# Altium project DS1682.PrjPcb
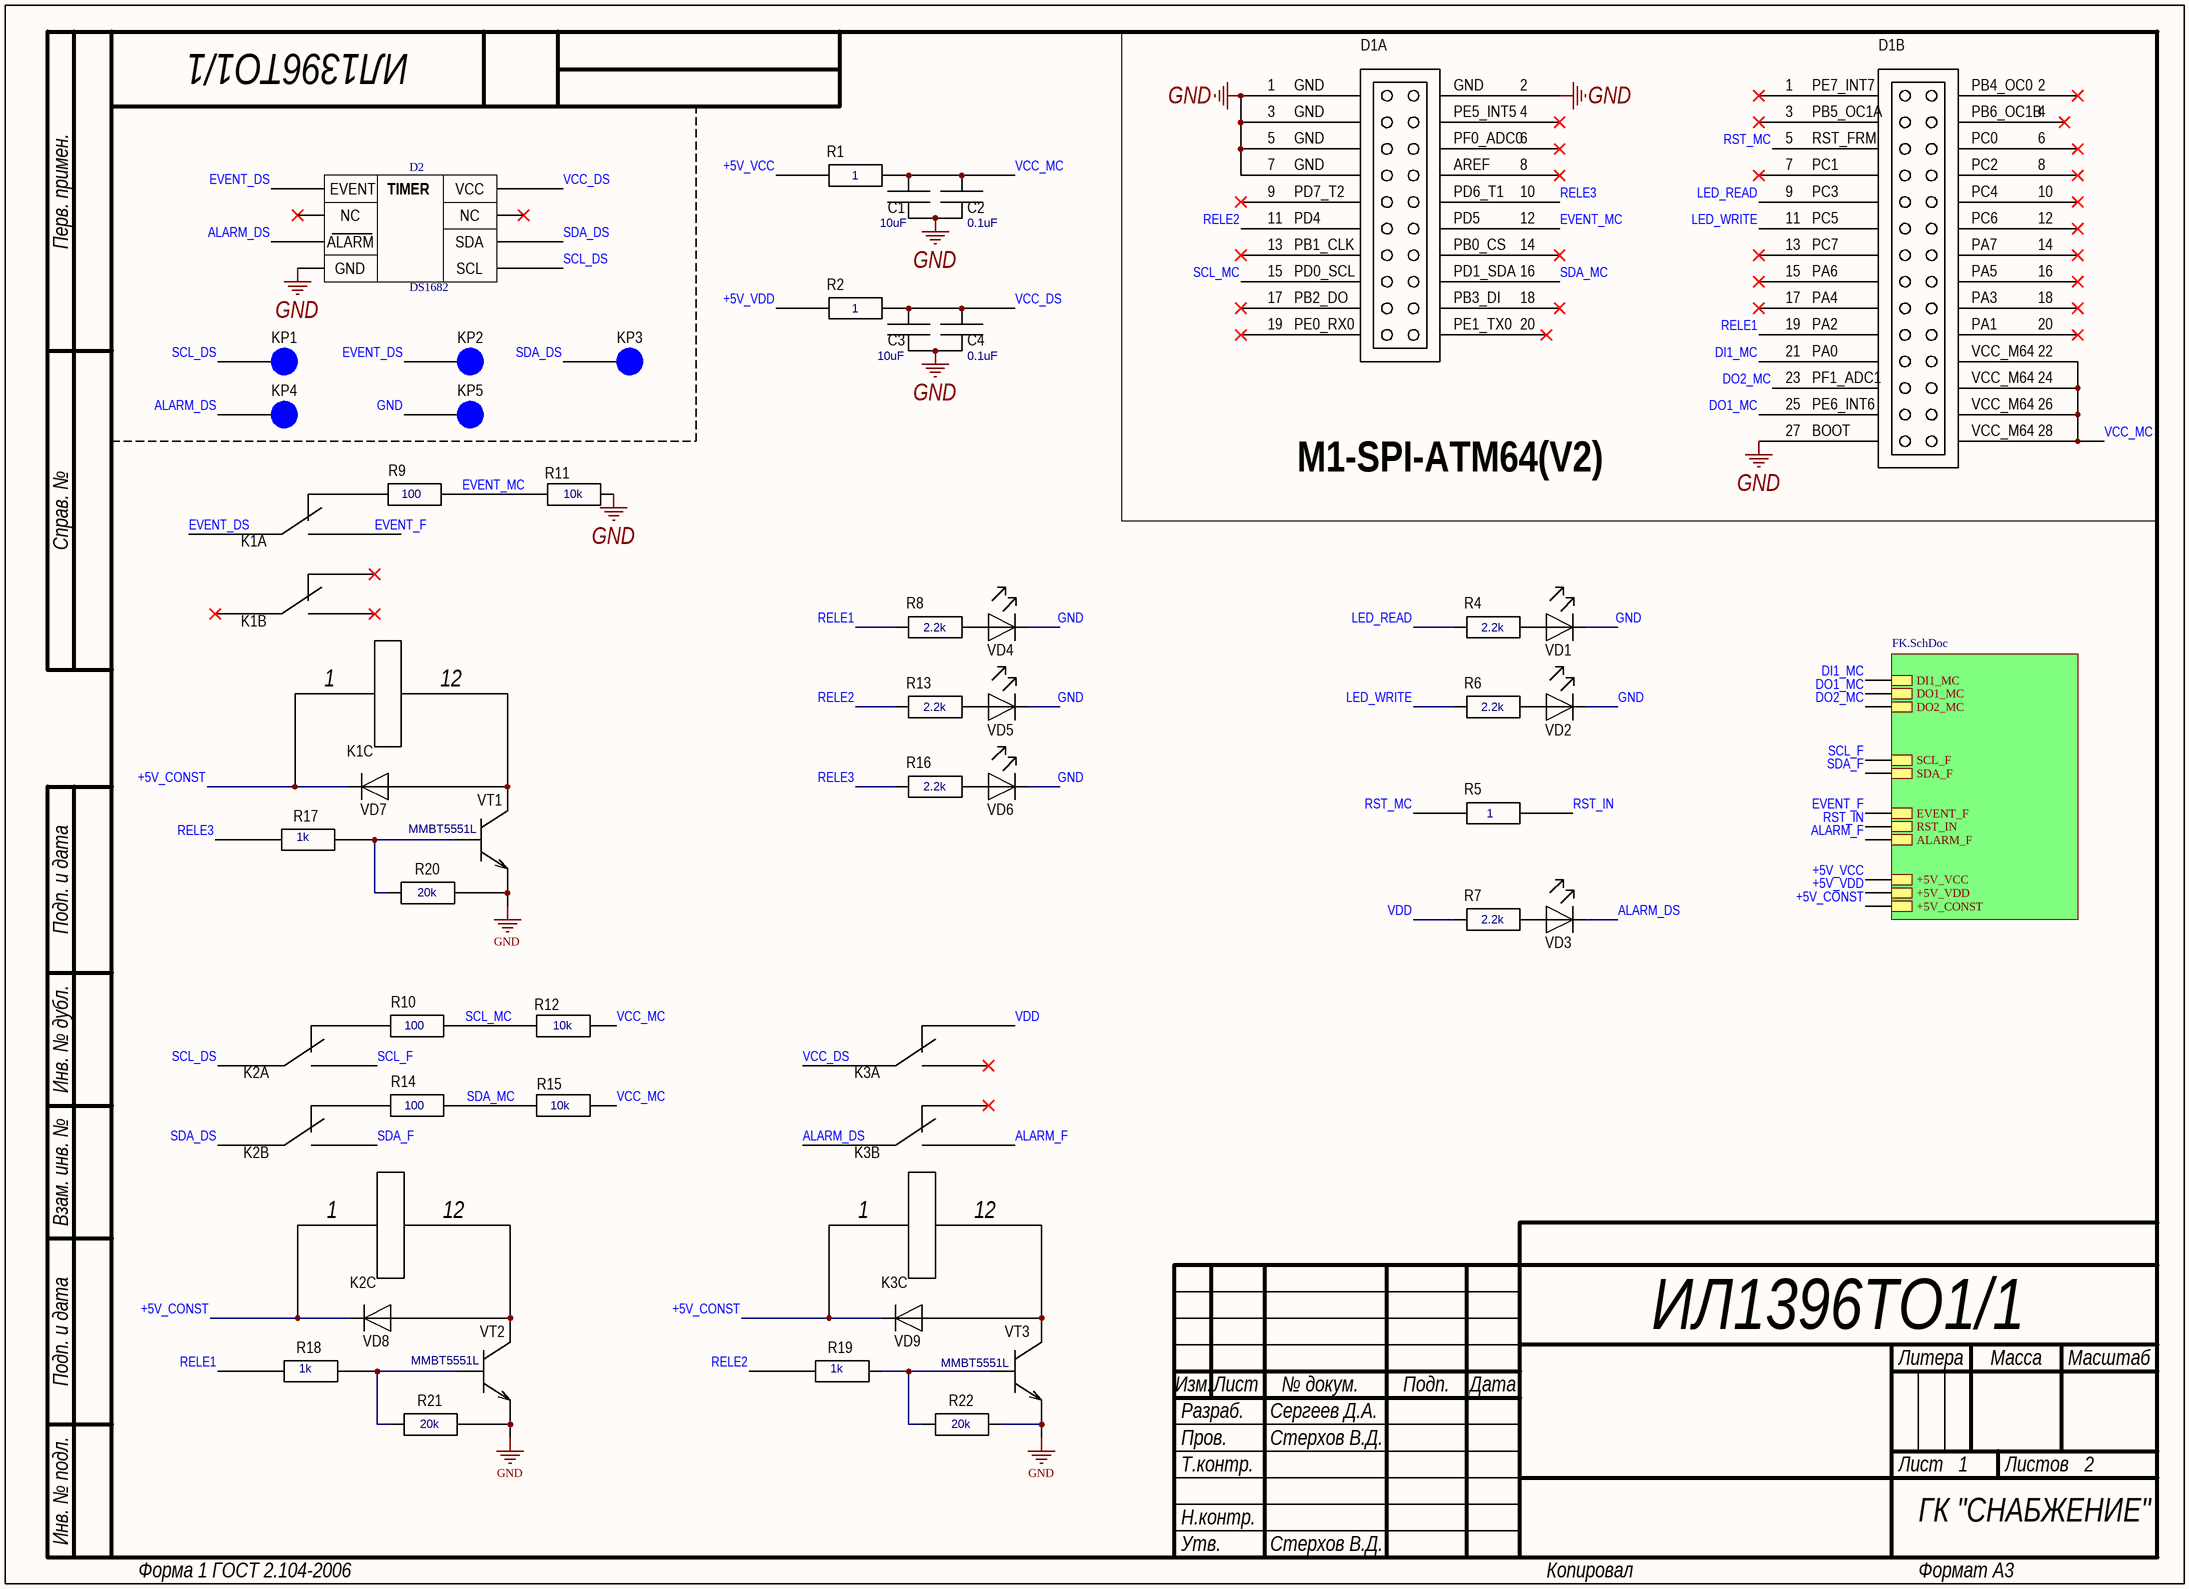
[diagram p0: Sheet1.SchDoc]
2 sheets, 48 parts. Net scope: hierarchical (ports join the sheet entries above them; power ports are global).
Board file: PCB1.PcbDoc
Sheets:
  Sheet1.SchDoc
    UCP_s22 = FK.SchDoc

## Sheet Sheet1.SchDoc: ИЛ1396ТО1/1
size 410 x 297 mm; ApprovedBy: Стерхов В.Д.; CheckedBy: Стерхов В.Д.; Author: Сергеев Д.А.; CompanyName: ГК "СНАБЖЕНИЕ"; DrawnBy: Сергеев Д.А.; Engineer: Сергеев Д.А.; Organization: ГК "СНАБЖЕНИЕ"; DocumentNumber: ИЛ1396ТО1/1; Revision: 1; SheetNumber: 1; SheetTotal: 2

### Parts
C1  10uF  [0805]
C2  0.1uF  [0805]
C3  10uF  [0805]
C4  0.1uF  [0805]
D1  M1-SPI-ATM64(V2)  [M1-SPI-ATM64(V2)]  (value not drawn)  (parts A,B of 2)
D2  DS1682  [SO-8 to PLS-8]
K1  V23079A1001B301 TE  [V23079A1001B301]  (value not drawn)  (parts A,B,C of 3)
K2  V23079A1001B301 TE  [V23079A1001B301]  (value not drawn)  (parts A,B,C of 3)
K3  V23079A1001B301 TE  [V23079A1001B301]  (value not drawn)  (parts A,B,C of 3)
KP1  Contact  [Contact]  (value not drawn)
KP2  Contact  [Contact]  (value not drawn)
KP3  Contact  [Contact]  (value not drawn)
KP4  Contact  [Contact]  (value not drawn)
KP5  Contact  [Contact]  (value not drawn)
R1  1  [0805]
R2  1  [0805]
R4  2.2k  [0805]
R5  1  [0805]
R6  2.2k  [0805]
R7  2.2k  [0805]
R8  2.2k  [0805]
R9  100  [0805]
R10  100  [0805]
R11  10k  [0805]
R12  10k  [0805]
R13  2.2k  [0805]
R14  100  [0805]
R15  10k  [0805]
R16  2.2k  [0805]
R17  1k  [0805]
R18  1k  [0805]
R19  1k  [0805]
R20  20k  [0805]
R21  20k  [0805]
R22  20k  [0805]
VD1  LED(0805)  [0805(LED)]  (value not drawn)
VD2  LED(0805)  [0805(LED)]  (value not drawn)
VD3  LED(0805)  [0805(LED)]  (value not drawn)
VD4  LED(0805)  [0805(LED)]  (value not drawn)
VD5  LED(0805)  [0805(LED)]  (value not drawn)
VD6  LED(0805)  [0805(LED)]  (value not drawn)
VD7  LL4148 NXP  [SOD80C]  (value not drawn)
VD8  LL4148 NXP  [SOD80C]  (value not drawn)
VD9  LL4148 NXP  [SOD80C]  (value not drawn)
VT1  MMBT5551L  [SOT-23]
VT2  MMBT5551L  [SOT-23]
VT3  MMBT5551L  [SOT-23]

### Sub-sheets
UCP_s22 = FK.SchDoc: DI1_MC, +5V_CONST, EVENT_F, RST_IN, +5V_VCC, SDA_F, DO1_MC, +5V_VDD, DO2_MC, ALARM_F, SCL_F

### Nets
GND: C1.2 C2.2 C3.2 C4.2 D1.1X2 D1.2X2 D1.3X2 D1.5X2 D1.7X2 D1.27X3 D2.4 KP5.1 R11.2 R20.2 R21.2 R22.2 VD1.2(K) VD2.2(K) VD4.2(K) VD5.2(K) VD6.2(K) VT1.2(E) VT2.2(E) VT3.2(E)
+5V_CONST: K1.1 K2.1 K3.1 VD7.2(K) VD8.2(K) VD9.2(K) ; sheet UCP_s22/+5V_CONST
+5V_VCC: R1.1 ; sheet UCP_s22/+5V_VCC
+5V_VDD: R2.1 ; sheet UCP_s22/+5V_VDD
ALARM_DS: D2.3 K3.9 KP4.1 VD3.2(K)
ALARM_F: K3.8 ; sheet UCP_s22/ALARM_F
DI1_MC: D1.21X3 ; sheet UCP_s22/DI1_MC
DO1_MC: D1.25X3 ; sheet UCP_s22/DO1_MC
DO2_MC: D1.23X3 ; sheet UCP_s22/DO2_MC
EVENT_DS: D2.1 K1.4 KP2.1
EVENT_F: K1.5 ; sheet UCP_s22/EVENT_F
EVENT_MC: D1.12X2 R9.2 R11.1
LED_READ: D1.9X3 R4.1
LED_WRITE: D1.11X3 R6.1
RELE1: D1.19X3 R8.1 R18.1
RELE2: D1.11X2 R13.1 R19.1
RELE3: D1.10X2 R16.1 R17.1
RST_IN: R5.2 ; sheet UCP_s22/RST_IN
RST_MC: D1.5X3 R5.1
SCL_DS: D2.5 K2.4 KP1.1
SCL_F: K2.5 ; sheet UCP_s22/SCL_F
SCL_MC: D1.15X2 R10.2 R12.1
SDA_DS: D2.6 K2.9 KP3.1
SDA_F: K2.8 ; sheet UCP_s22/SDA_F
SDA_MC: D1.16X2 R14.2 R15.1
VCC_DS: C3.1 C4.1 D2.8 K3.4 R2.2
VCC_MC: C1.1 C2.1 D1.22X3 D1.24X3 D1.26X3 D1.28X3 R1.2 R12.2 R15.2
VDD: K3.3 R7.1
NetK1_3: K1.3 R9.1
NetK1_12: K1.12 VD7.1(A) VT1.3(K)
NetK2_3: K2.3 R10.1
NetK2_10: K2.10 R14.1
NetK2_12: K2.12 VD8.1(A) VT2.3(K)
NetK3_12: K3.12 VD9.1(A) VT3.3(K)
NetR4_2: R4.2 VD1.1(A)
NetR6_2: R6.2 VD2.1(A)
NetR7_2: R7.2 VD3.1(A)
NetR8_2: R8.2 VD4.1(A)
NetR13_2: R13.2 VD5.1(A)
NetR16_2: R16.2 VD6.1(A)
NetR17_2: R17.2 R20.1 VT1.1(B)
NetR18_2: R18.2 R21.1 VT2.1(B)
NetR19_2: R19.2 R22.1 VT3.1(B)

Not connected (* = marked no-connect by the designer): D1 1X3* 2X3* 3X3* 4X2* 4X3* 6X2* 6X3* 7X3* 8X2* 8X3* 9X2* 10X3* 12X3* 13X2* 13X3* 14X2* 14X3* 15X3* 16X3* 17X2* 17X3* 18X2* 18X3* 19X2* 20X2* 20X3*; D2 2* 7*; K1 8* 9* 10*; K3 5* 10*

### Notes on the sheet
- M1-SPI-ATM64(V2)
- Перв. примен.
- Справ. №
- Подп. и дата
- Инв. № дубл.
- Взам. инв. №
- Разраб.
- Изм.
- Лист
- № докум.
- Подп.
- Дата
- Литера
- Масса
- Масштаб
- Пров.
- Т.контр.
- Листов
- Инв. № подл.
- Н.контр.
- Утв.
- Форма 1 ГОСТ 2.104-2006
- Копировал
- Формат А3

### Library data of the parts
C1-C4 = C0805: ComponentHeigt: 1.3; Firme: AVX; Leadform: SMD; KIND: Конденсатор; ClassName: *; Component Link: *; ComponentWeigt: *; Packaging: 0805; NN: *; Value: *
D1 = M1-SPI-ATM64(V2): ComponentHeigt: 5.5; Name: Вилка; Specification: Вилка PLD2-2 *; Typ: PLD2-2; ClassName: *; Component Link: *; ComponentWeigt: *; Firme: *; Leadform: *; NN: *; KIND: *
R1 R2 R4-R22 = R0805 Yageo: ComponentHeigt: 0.6; Firme: Yageo; Leadform: SMD; Kind: Резистор; ClassName: *; ComponentWeigt: *; Component Link: *; Packaging: 0805; NN: *; Value: *
VD1-VD6 = LED(0805): ComponentHeigt: 0.75; Leadform: в отверстия; Firme: Kingbright; NN: 24003000; KIND: Светодиод L-1154GD Kingbright; Component Link: *; ClassName: *
VD7-VD9 = LL4148 NXP: ComponentHeigt: 1.6; Leadform: SMD; NN: 24009301; KIND: Диод LL4148 NXP; Component Link: http://www.nxp.com; Packaging: SOD-80C; ClassName: *; Firme: NXP
VT1-VT3 = MMBT5551L: ComponentHeigt: 1.1; Firme: ONS; Leadform: SMD; NN: 24007468; KIND: Транзистор MMBT5551L*G ONS; ClassName: *; ComponentWeigt: *; Packaging: SOT-23

## Sheet FK.SchDoc: ИЛ1396ТО1/1
size 410 x 297 mm; ApprovedBy: Стерхов В.Д.; CheckedBy: Стерхов В.Д.; Author: Сергеев Д.А.; CompanyName: ГК "СНАБЖЕНИЕ"; DrawnBy: Сергеев Д.А.; Engineer: Сергеев Д.А.; Organization: ГК "СНАБЖЕНИЕ"; DocumentNumber: ИЛ1396ТО1/1; Revision: 1; SheetNumber: 2; SheetTotal: 2
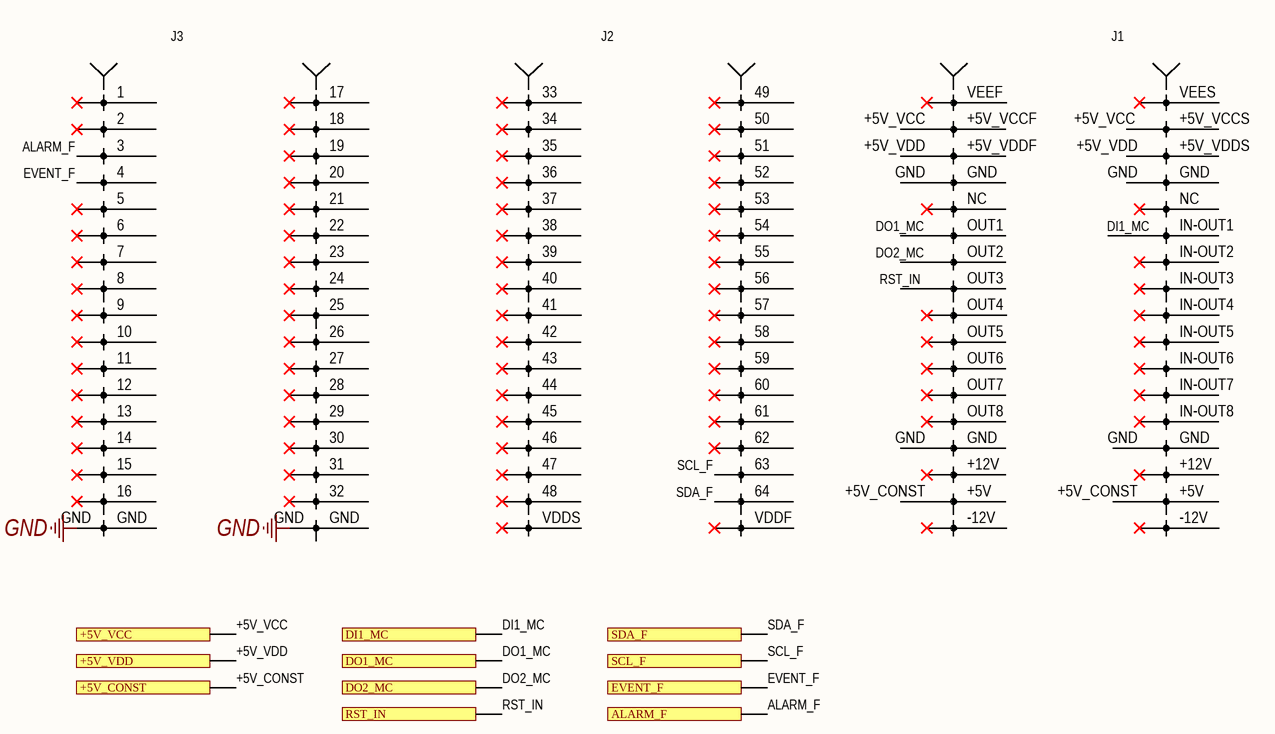
[diagram p1: FK.SchDoc]

### Parts
X1  FORMULA  [FORMULA]  (value not drawn)

### Ports
+5V_CONST, +5V_VCC, +5V_VDD, ALARM_F, DI1_MC, DO1_MC, DO2_MC, EVENT_F, RST_IN, SCL_F, SDA_F

### Nets
GND: X1.GND
+5V_CONST: X1.+5V ; port +5V_CONST
+5V_VCC: X1.+5V_VCCF(VCCF) X1.+5V_VCCS(VCCS) ; port +5V_VCC
+5V_VDD: X1.+5V_VDDF(VDDF) X1.+5V_VDDS(VDDS) ; port +5V_VDD
ALARM_F: X1.3 ; port ALARM_F
DI1_MC: X1.IN-OUT1 ; port DI1_MC
DO1_MC: X1.OUT1 ; port DO1_MC
DO2_MC: X1.OUT2 ; port DO2_MC
EVENT_F: X1.4 ; port EVENT_F
RST_IN: X1.OUT3 ; port RST_IN
SCL_F: X1.63 ; port SCL_F
SDA_F: X1.64 ; port SDA_F

Not connected (* = marked no-connect by the designer): X1 1* 2* 5* 6* 7* 8* 9* 10* 11* 12* 13* 14* 15* 16* 17* 18* 19* 20* 21* 22* 23* 24* 25* 26* 27* 28* 29* 30* 31* 32* 33* 34* 35* 36(4)* 37(5)* 38* 39* 40* 41* 42* 43* 44* 45* 46* 47* 48* 49* 50* 51* 52* 53* 54* 55* 56* 57* 58* 59* 60* 61* 62* +12V* -12V* IN-OUT2* IN-OUT3* IN-OUT4* IN-OUT5* IN-OUT6* IN-OUT7* IN-OUT8* NC* OUT4* OUT5* OUT6* OUT7* OUT8* VDDF* VDDS* VEEF* VEES*

### Notes on the sheet
- Перв. примен.
- Справ. №
- Подп. и дата
- Инв. № дубл.
- Взам. инв. №
- Разраб.
- Изм.
- Лист
- № докум.
- Подп.
- Дата
- Литера
- Масса
- Масштаб
- Пров.
- Т.контр.
- Листов
- Инв. № подл.
- Н.контр.
- Утв.
- Форма 1 ГОСТ 2.104-2006
- Копировал
- Формат А3
- (in symbol FORMULA) J3; J2; J1

## Nets that join several sheets
GND: Sheet1 (24 pins), FK (X1.GND)
+5V_CONST: Sheet1 (6 pins), FK (X1.+5V)
+5V_VCC: Sheet1 (R1.1), FK (X1.+5V_VCCF X1.+5V_VCCS)
+5V_VDD: Sheet1 (R2.1), FK (X1.+5V_VDDF X1.+5V_VDDS)
ALARM_F: Sheet1 (K3.8), FK (X1.3)
DI1_MC: Sheet1 (D1.21X3), FK (X1.IN-OUT1)
DO1_MC: Sheet1 (D1.25X3), FK (X1.OUT1)
DO2_MC: Sheet1 (D1.23X3), FK (X1.OUT2)
EVENT_F: Sheet1 (K1.5), FK (X1.4)
RST_IN: Sheet1 (R5.2), FK (X1.OUT3)
SCL_F: Sheet1 (K2.5), FK (X1.63)
SDA_F: Sheet1 (K2.8), FK (X1.64)